# Altium schematic sheet 01_Main_Circuit.SchDoc (part 1 of 2)
size A3; SheetNumber: 1; SheetTotal: 1
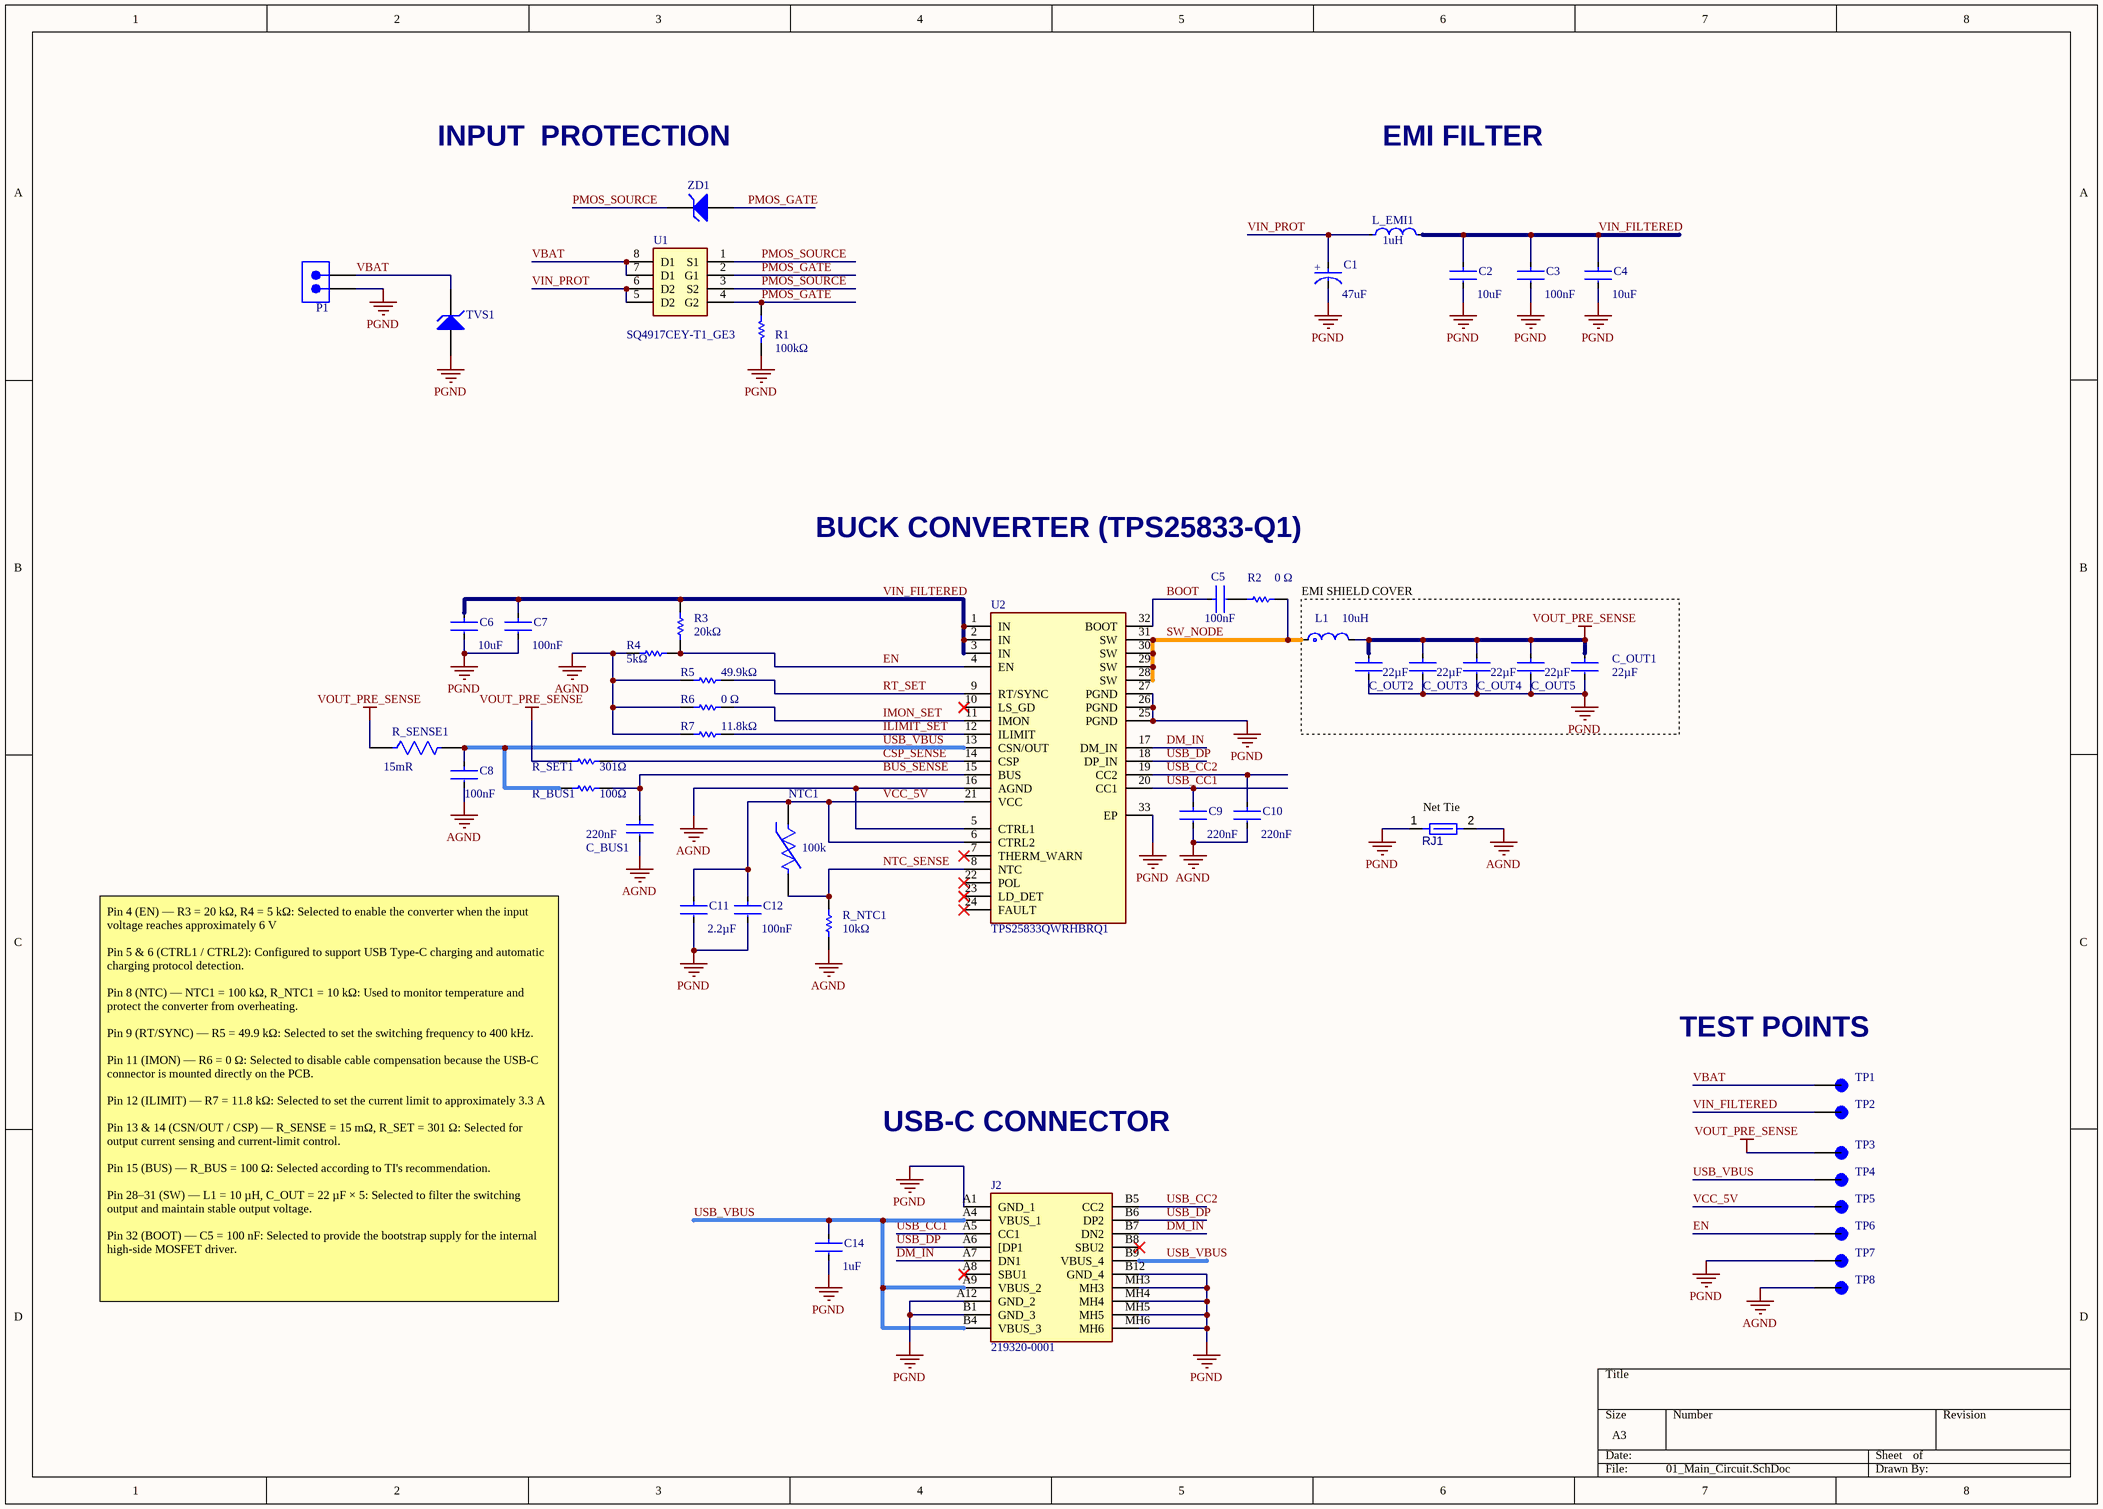
[diagram p0: 01_Main_Circuit.SchDoc]

## Parts
C1  Capacitance: 47uF  [FP-EDH476M050S9HAA-IPC_C]  (hidden comment: EDH476M050S9HAA)
C2  Capacitance: 10uF  [FP-CGA5L-0_3-0_1-IPC_B]  (hidden comment: CGA5L1X7R1H106K160AC)
C3  Capacitance: 100nF  [FP-CGA3E-0_3-0_1-MFG]  (hidden comment: CGA3E2X7R1H104K080AA)
C4  Capacitance: 10uF  [FP-CGA5L-0_3-0_1-IPC_B]  (hidden comment: CGA5L1X7R1H106K160AC)
C5  Capacitance: 100nF  [FP-CGA3E-0_3-0_1-MFG]  (hidden comment: CGA3E2X7R1H104K080AA)
C6  Capacitance: 10uF  [FP-CGA5L-0_3-0_1-IPC_B]  (hidden comment: CGA5L1X7R1H106K160AC)
C7  Capacitance: 100nF  [FP-CGA3E-0_3-0_1-MFG]  (hidden comment: CGA3E2X7R1H104K080AA)
C8  Capacitance: 100nF  [FP-CGA3E-0_3-0_1-MFG]  (hidden comment: CGA3E2X7R1H104K080AA)
C9  value 220nF  [FP-CGA2B-MFG]  (hidden comment: C1005X5R1E224M050BC)
C10  value 220nF  [FP-CGA2B-MFG]  (hidden comment: C1005X5R1E224M050BC)
C11  value 2.2µF  [FP-CGA2B-MFG]  (hidden comment: GRT155R61E225KE13D)
C12  Capacitance: 100nF  [FP-CGA2B-MFG]  (hidden comment: CGA2B3X7R1E104K050BB)
C14  Capacitance: 1uF  [FP-CGA3E-0_3-0_1-MFG]  (hidden comment: CGA3E2X5R1A105K080AA)
C_BUS1  value 220nF  [FP-CGA2B-MFG]  (hidden comment: C1005X5R1E224M050BC)
C_OUT1  value 22µF  [FP-CGA5L-0_3-0_1-IPC_B]  (hidden comment: GRT31CR61E226KE01L)
C_OUT2  value 22µF  [FP-CGA5L-0_3-0_1-IPC_B]  (hidden comment: GRT31CR61E226KE01L)
C_OUT3  value 22µF  [FP-CGA5L-0_3-0_1-IPC_B]  (hidden comment: GRT31CR61E226KE01L)
C_OUT4  value 22µF  [FP-CGA5L-0_3-0_1-IPC_B]  (hidden comment: GRT31CR61E226KE01L)
C_OUT5  value 22µF  [FP-CGA5L-0_3-0_1-IPC_B]  (hidden comment: GRT31CR61E226KE01L)
J2  219320-0001  [2193200001]
L1  Inductance: 10uH  [FP-XAL6060-MFG]  (hidden comment: XAL6060-103MEB)
L_EMI1  value 1uH  [FP-XAL4020-102MEC-MFG]  (hidden comment: XAL4020-102MEC)
NTC1  Resistance: 100k  [FP-NCU18-0_15-IPC_C]  (hidden comment: NCU18WF104F6SRB)
P1  638207122002  [638263122002]  (value not drawn)
R1  value 100kΩ  [RESC0603(1608)_N]  (hidden comment: 100K 1% 0603(1608))
R2  Resistance: 0 Ω  [RESC1005X40X25NL05T05]  (hidden comment: ERJ2GE0R00X)
R3  value 20kΩ  [RESC1005X40X25NL05T05]
R4  value 5kΩ  [RESC1005X40X25NL05T05]
R5  value 49.9kΩ  [RESC1005X40X25NL05T05]  (hidden comment: ERJ-2RKF4992X)
R6  Resistance: 0 Ω  [RESC1005X40X25NL05T05]  (hidden comment: ERJ2GE0R00X)
R7  value 11.8kΩ  [RESC1005X40X25NL05T05]  (hidden comment: CRCW040211K8FKEE)
R_BUS1  value 100Ω  [RESC2013X60X30NL20T20]  (hidden comment: RK73B2ATTD101J)
R_NTC1  value 10kΩ  [RESC1005X40X25NL05T05]
R_SENSE1  Resistance: 15mR  [FP-CSR1206-IPC_B]  (hidden comment: CSR1206FK15L0)
R_SET1  value 301Ω  [RESC1005X40X25NL05T05]  (hidden comment: CRCW0402301RFKED)
RJ1  Net Tie 0.6x1.4mm  [SHORT10_8MIL-FP]  (value not drawn)  (net tie, no BOM)
TP1  Test point  (value not drawn)
TP2  Test point  (value not drawn)
TP3  Test point  (value not drawn)
TP4  Test point  (value not drawn)
TP5  Test point  (value not drawn)
TP6  Test point  (value not drawn)
TP7  Test point  (value not drawn)
TP8  Test point  (value not drawn)
TVS1  (no value)  [ONSC-SMB-2-403A-03_H_V]
U1  SQ4917CEY-T1_GE3  [FP-C04-057-SN-MFG]
U2  TPS25833QWRHBRQ1  [FP-RHB0032D-MFG]
ZD1  (no value)  [ONSC-SOD-123-2-425-04_V]

## Blocks framed on the sheet
EMI SHIELD COVER: C_OUT1-C_OUT5 L1

## Nets
AGND: C8.2 C9.2 C10.2 C_BUS1.2 R4.1 R5.1 R6.1 R7.1 R_NTC1.1 RJ1.2 TP8.1(TP) U2.5(CTRL1) U2.16(AGND)
PGND: C1.1(C) C2.2 C3.2 C4.2 C6.2 C7.2 C11.2 C12.2 C14.2 C_OUT1.2 C_OUT2.2 C_OUT3.2 C_OUT4.2 C_OUT5.2 J2.A1(GND_1) J2.A12(GND_2) J2.B1(GND_3) J2.B12(GND_4) J2.MH3 J2.MH4 J2.MH5 J2.MH6 P1.1 R1.1 RJ1.1 TP7.1(TP) TVS1.2(A) U2.25(PGND) U2.26(PGND) U2.27(PGND) U2.33(EP)
VOUT_PRE_SENSE: C_OUT1.1 C_OUT2.1 C_OUT3.1 C_OUT4.1 C_OUT5.1 L1.2 R_SENSE1.1 R_SET1.1 TP3.1(TP)
BOOT: C5.1 U2.32(BOOT)
BUS_SENSE: C_BUS1.1 R_BUS1.2 U2.15(BUS)
CSP_SENSE: R_SET1.2 U2.14(CSP)
DM_IN: J2.A7(DN1) J2.B7(DN2) U2.17(DM_IN)
EN: R3.1 R4.2 TP6.1(TP) U2.4(EN)
ILIMIT_SET: R7.2 U2.12(ILIMIT)
IMON_SET: R6.2 U2.11(IMON)
NTC_SENSE: NTC1.2 R_NTC1.2 U2.8(NTC)
PMOS_GATE: R1.2 U1.2(G1) U1.4(G2) ZD1.2(A)
PMOS_SOURCE: U1.1(S1) U1.3(S2) ZD1.1(K)
RT_SET: R5.2 U2.9(RT/SYNC)
SW_NODE: L1.1 R2.2 U2.28(SW) U2.29(SW) U2.30(SW) U2.31(SW)
USB_CC1: C9.1 J2.A5(CC1) U2.20(CC1)
USB_CC2: C10.1 J2.B5(CC2) U2.19(CC2)
USB_DP: J2.A6([DP1) J2.B6(DP2) U2.18(DP_IN)
USB_VBUS: C8.1 C14.1 J2.A4(VBUS_1) J2.A9(VBUS_2) J2.B4(VBUS_3) J2.B9(VBUS_4) R_BUS1.1 R_SENSE1.2 TP4.1(TP) U2.13(CSN/OUT)
VBAT: P1.2 TP1.1(TP) TVS1.1(K) U1.7(D1) U1.8(D1)
VCC_5V: C11.1 C12.1 NTC1.1 TP5.1(TP) U2.6(CTRL2) U2.21(VCC)
VIN_FILTERED: C2.1 C3.1 C4.1 C6.1 C7.1 L_EMI1.2 R3.2 TP2.1(TP) U2.1(IN) U2.2(IN) U2.3(IN)
VIN_PROT: C1.2(A) L_EMI1.1 U1.5(D2) U1.6(D2)
NetC5_2: C5.2 R2.1

Not connected (* = marked no-connect by the designer): J2 A8(SBU1)* B8(SBU2)*; U2 7(THERM_WARN)* 10(LS_GD)* 22(POL)* 23(LD_DET)* 24(FAULT)*

## Notes on the sheet
- INPUT  PROTECTION
- EMI FILTER
- BUCK CONVERTER (TPS25833-Q1)
- (near RJ1) Net Tie
- (near TP1) TEST POINTS
- USB-C CONNECTOR
- Pin 4 (EN) — R3 = 20 kΩ, R4 = 5 kΩ: Selected to enable the converter when the input voltage reaches approximately 6 V
  Pin 5 & 6 (CTRL1 / CTRL2): Configured to support USB Type-C charging and automatic charging protocol detection.
  Pin 8 (NTC) — NTC1 = 100 kΩ, R_NTC1 = 10 kΩ: Used to monitor temperature and protect the converter from overheating.
  Pin 9 (RT/SYNC) — R5 = 49.9 kΩ: Selected to set the switching frequency to 400 kHz.
  Pin 11 (IMON) — R6 = 0 Ω: Selected to disable cable compensation because the USB-C connector is mounted directly on the PCB.
  Pin 12 (ILIMIT) — R7 = 11.8 kΩ: Selected to set the current limit to approximately 3.3 A
  Pin 13 & 14 (CSN/OUT / CSP) — R_SENSE = 15 mΩ, R_SET = 301 Ω: Selected for output current sensing and current-limit control.
  Pin 15 (BUS) — R_BUS = 100 Ω: Selected according to TI's recommendation.
  Pin 28–31 (SW) — L1 = 10 µH, C_OUT = 22 µF × 5: Selected to filter the switching output and maintain stable output voltage.
  Pin 32 (BOOT) — C5 = 100 nF: Selected to provide the bootstrap supply for the internal high-side MOSFET driver.
- (in symbol CMP-03015-000011-1) +